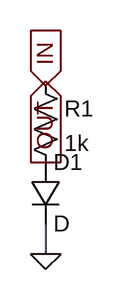
[diagram p0: schematic hier_device.asc]
hier_device.asc, the LTspice schematic file:
Version 4
SHEET 1 880 680
WIRE 0 160 0 192
FLAG 0 16 IN
IOPIN 0 16 In
FLAG 0 96 OUT
IOPIN 0 96 Out
FLAG 0 192 0
SYMBOL res -16 0 R0
SYMATTR InstName R1
SYMATTR Value 1k
SYMBOL diode -16 96 R0
SYMATTR InstName D1
SYMATTR Value D

The netlist it stands for:
* hier_device.asc
R1 IN OUT 1k
D1 OUT 0 D
.model D D
.lib standard.dio
.backanno
.end